# Altium schematic sheet Connect.SchDoc
size A4
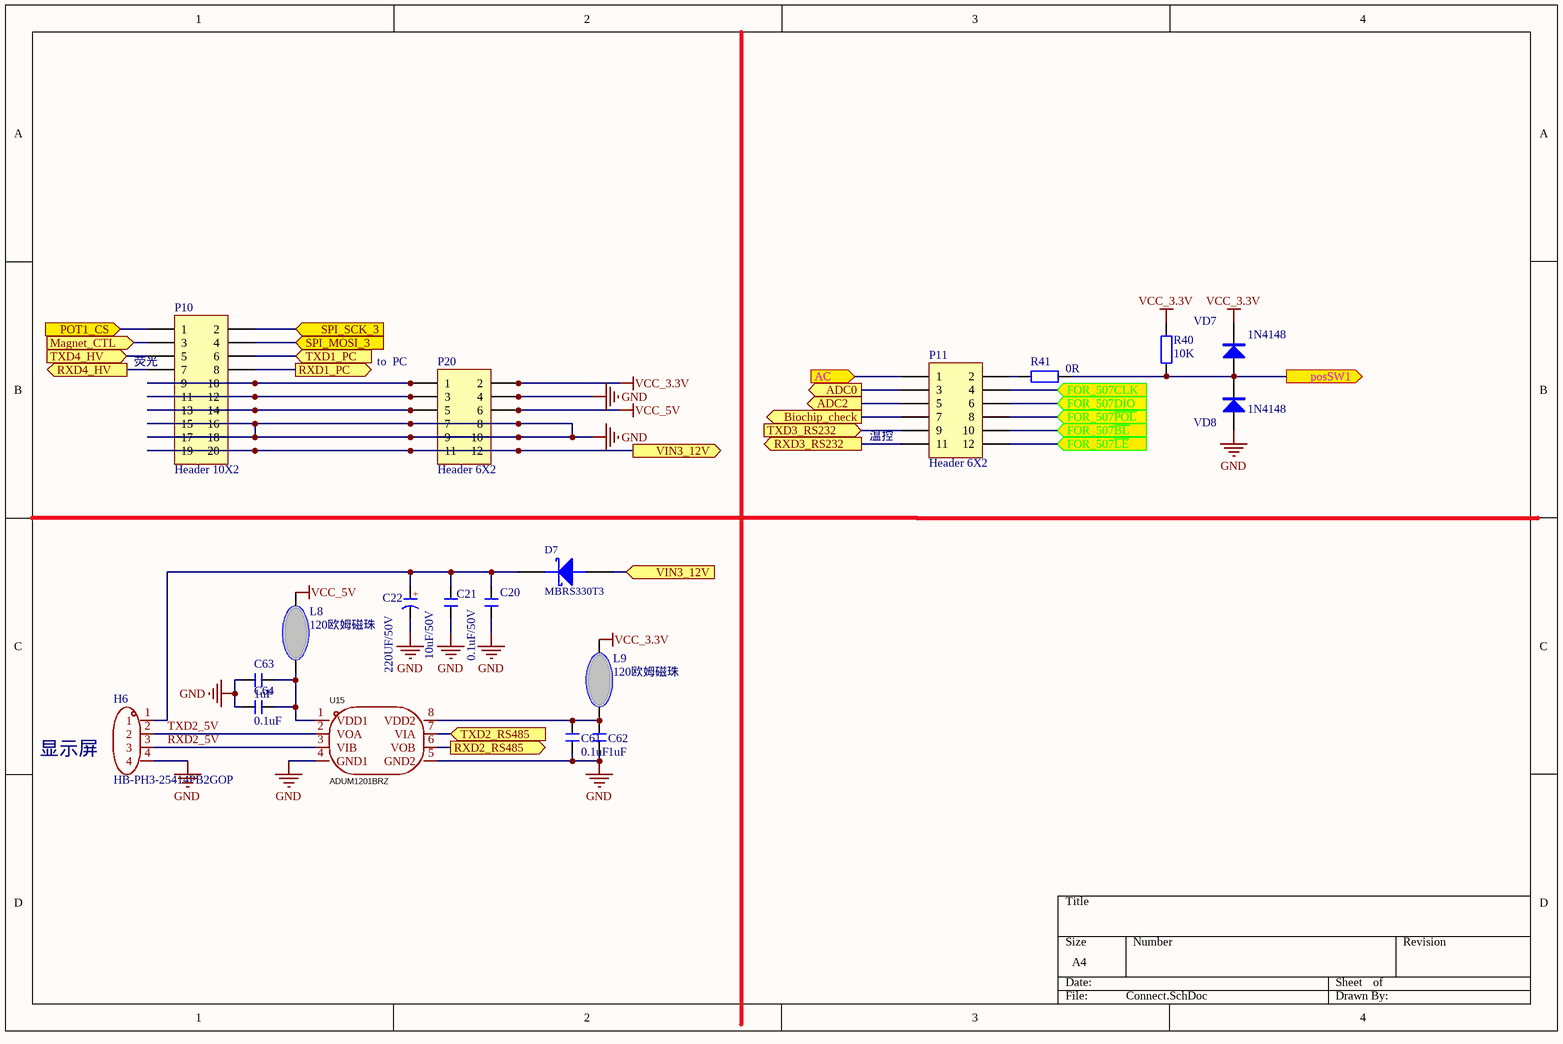
[diagram p0: Connect.SchDoc]

## Parts
C20  0.1uF/50V  [C 1206]
C21  10uF/50V  [C 1206]
C22  220UF/50V  [CAP 5.0*10*12.5]
C61  0.1uF  [C 0603]
C62  1uF  [C 0603]
C63  1uF  [C 0603]
C64  0.1uF  [C 0603]
D7  MBRS330T3  [MBRS340]
H6  HB-PH3-25414PB2GOP  [CONN-TH_4P-P2.50_ZX-XH2.54-4PZZ-Y]
L8  120欧姆磁珠  [L 0603]
L9  120欧姆磁珠  [L 0603]
P10  Header 10X2  [HDR-10X2]
P11  Header 6X2  [HDR-6X2]
P20  Header 6X2  [HDR-6X2]
R40  10K  [R 0603]
R41  0R  [R 0603]
U15  ADUM1201BRZ  [SOIC-8_L4.9-W3.9-P1.27-LS6.0-BL]
VD7  1N4148  [SOD-323]
VD8  1N4148  [SOD-323]

## Ports
AC (in), ADC0 (out), ADC2 (out), Biochip_check (out), FOR_507CLK (in), FOR_507DIO (in), FOR_507~{BL} (in), FOR_507~{LE} (in), FOR_507~{POL} (in), Magnet_CTL (in), posSW1 (out), POT1_CS (in), RXD1_PC (out), RXD2_RS485 (out), RXD3_RS232 (out), RXD4_HV (out), SPI_MOSI_3 (in), SPI_SCK_3 (in), TXD1_PC (in), TXD2_RS485 (in), TXD3_RS232 (in), TXD4_HV (in), VIN3_12V (in), VIN3_12V (out)

## Nets
GND: C20.1 C21.1 C22.2 C61.2 C62.2 C63.2 C64.2 H6.4 P10.11 P10.12 P10.15 P10.16 P10.17 P10.18 P20.3 P20.4 P20.7 P20.8 P20.9 P20.10 U15.4(GND1) U15.5(GND2) VD8.1(A)
VCC_3.3V: L9.2 P10.9 P10.10 P20.1 P20.2 R40.1 VD7.2(K)
VCC_5V: L8.1 P10.13 P10.14 P20.5 P20.6
AC: P11.1 ; port AC
ADC0: P11.3 ; port ADC0
ADC2: P11.5 ; port ADC2
Biochip_check: P11.7 ; port Biochip_check
FOR_507~{BL}: P11.10 ; port FOR_507~{BL}
FOR_507CLK: P11.4 ; port FOR_507CLK
FOR_507DIO: P11.6 ; port FOR_507DIO
FOR_507~{LE}: P11.12 ; port FOR_507~{LE}
FOR_507~{POL}: P11.8 ; port FOR_507~{POL}
Magnet_CTL: P10.3 ; port Magnet_CTL
posSW1: R40.2 R41.1 VD7.1(A) VD8.2(K) ; port posSW1
POT1_CS: P10.1 ; port POT1_CS
RXD1_PC: P10.8 ; port RXD1_PC
RXD2_5V: H6.3 U15.3(VIB)
RXD2_RS485: U15.6(VOB) ; port RXD2_RS485
RXD3_RS232: P11.11 ; port RXD3_RS232
RXD4_HV: P10.7 ; port RXD4_HV
SPI_MOSI_3: P10.4 ; port SPI_MOSI_3
SPI_SCK_3: P10.2 ; port SPI_SCK_3
TXD1_PC: P10.6 ; port TXD1_PC
TXD2_5V: H6.2 U15.2(VOA)
TXD2_RS485: U15.7(VIA) ; port TXD2_RS485
TXD3_RS232: P11.9 ; port TXD3_RS232
TXD4_HV: P10.5 ; port TXD4_HV
VIN3_12V: D7.1(A) P10.19 P10.20 P20.11 P20.12 ; port VIN3_12V
NetC20_2: C20.2 C21.2 C22.1 D7.2(K) H6.1
NetC61_1: C61.1 C62.1 L9.1 U15.8(VDD2)
NetC63_1: C63.1 C64.1 L8.2 U15.1(VDD1)
NetP11_2: P11.2 R41.2

## Notes on the sheet
- (near P10) 荧光
- (near P20) to  PC
- (near P11) 温控
- 显示屏
- (in symbol C-CAP) +

## Library data of the parts
C20 C21 = C: 无极性贴片电容; 版权归属: 源创客; BOM名称: 无极性贴片电容; 学习资源: www.ooocke.com
C22 = C-CAP: 直插电解电容; 版权归属: 源创客; BOM名称: 直插电解电容; 学习资源: www.ooocke.com
C61-C64 = C-CC: 直插瓷片电容; 版权归属: 源创客; BOM名称: 直插瓷片电容; 学习资源: www.ooocke.com
D7 = DIODE SCHOTTKY: Schottky Diode
H6 = HB-PH3-25414PB2GOP: Add into BOM: yes; Pin Structure: 1x4P; Pitch: 2.54mm; Current Rating (Max): 3A; Voltage Rating (Max): 250V; Symbol: HB-PH3-25414PB2GOP; Device: HB-PH3-25414PB2GOP; Supplier Part: C6332197; Manufacturer Part: HB-PH3-25414PB2GOP; Datasheet: https://atta.szlcsc.com/upload/public/pdf/source/20230803/F72D259687963761DF1B552F3BB84A31.pdf; Supplier: LCSC; Convert to PCB: yes; Row Spacing: 2.54mm; Number of Pins: 4P; Length of Mating Pin: 6mm; Insulation Height: 2.54mm; Length of End Connection Pin: 3mm; Comment_1: HB-PH3-25414PB2GOP
L8 L9 = FERRITBEAD
P10 = Header 10X2: Header, 10-Pin, Dual row; LatestRevisionDate: 17-Jul-2002; LatestRevisionNote: Re-released for DXP Platform.; Publisher: Altium Limited
P11 P20 = Header 6X2: Header, 6-Pin, Dual row; LatestRevisionDate: 17-Jul-2002; LatestRevisionNote: Re-released for DXP Platform.; Publisher: Altium Limited
R40 R41 = R: 贴片电阻; 版权归属: 源创客; BOM名称: 贴片电阻; 学习资源: www.ooocke.com
U15 = ADUM1201BRZ: Add into BOM: yes; Number of Forward Channels: 1; Data Rate(Max): 10Mbps; Isolation Voltage(Vrms): 2500; Symbol: ADUM1201BRZ; Device: ADUM1201BRZ; Supplier Part: C579376; Manufacturer Part: ADUM1201BRZ; Supplier Footprint: SOIC-8; JLCPCB Part Class: Extended Part; Datasheet: https://atta.szlcsc.com/upload/public/pdf/source/20190717/C404334_2B93F55860F1199D4BB807185B15482E.pdf; Supplier: LCSC; Convert to PCB: yes; Number of Reverse Channels: 1
VD7 VD8 = 1N4148: 高速开关二极管; 版权归属: 源创客; BOM名称: 高速开关二极管; 学习资源: www.ooocke.com